# Altium schematic sheet MCU.SchDoc
size A; SheetNumber: 2; SheetTotal: 12
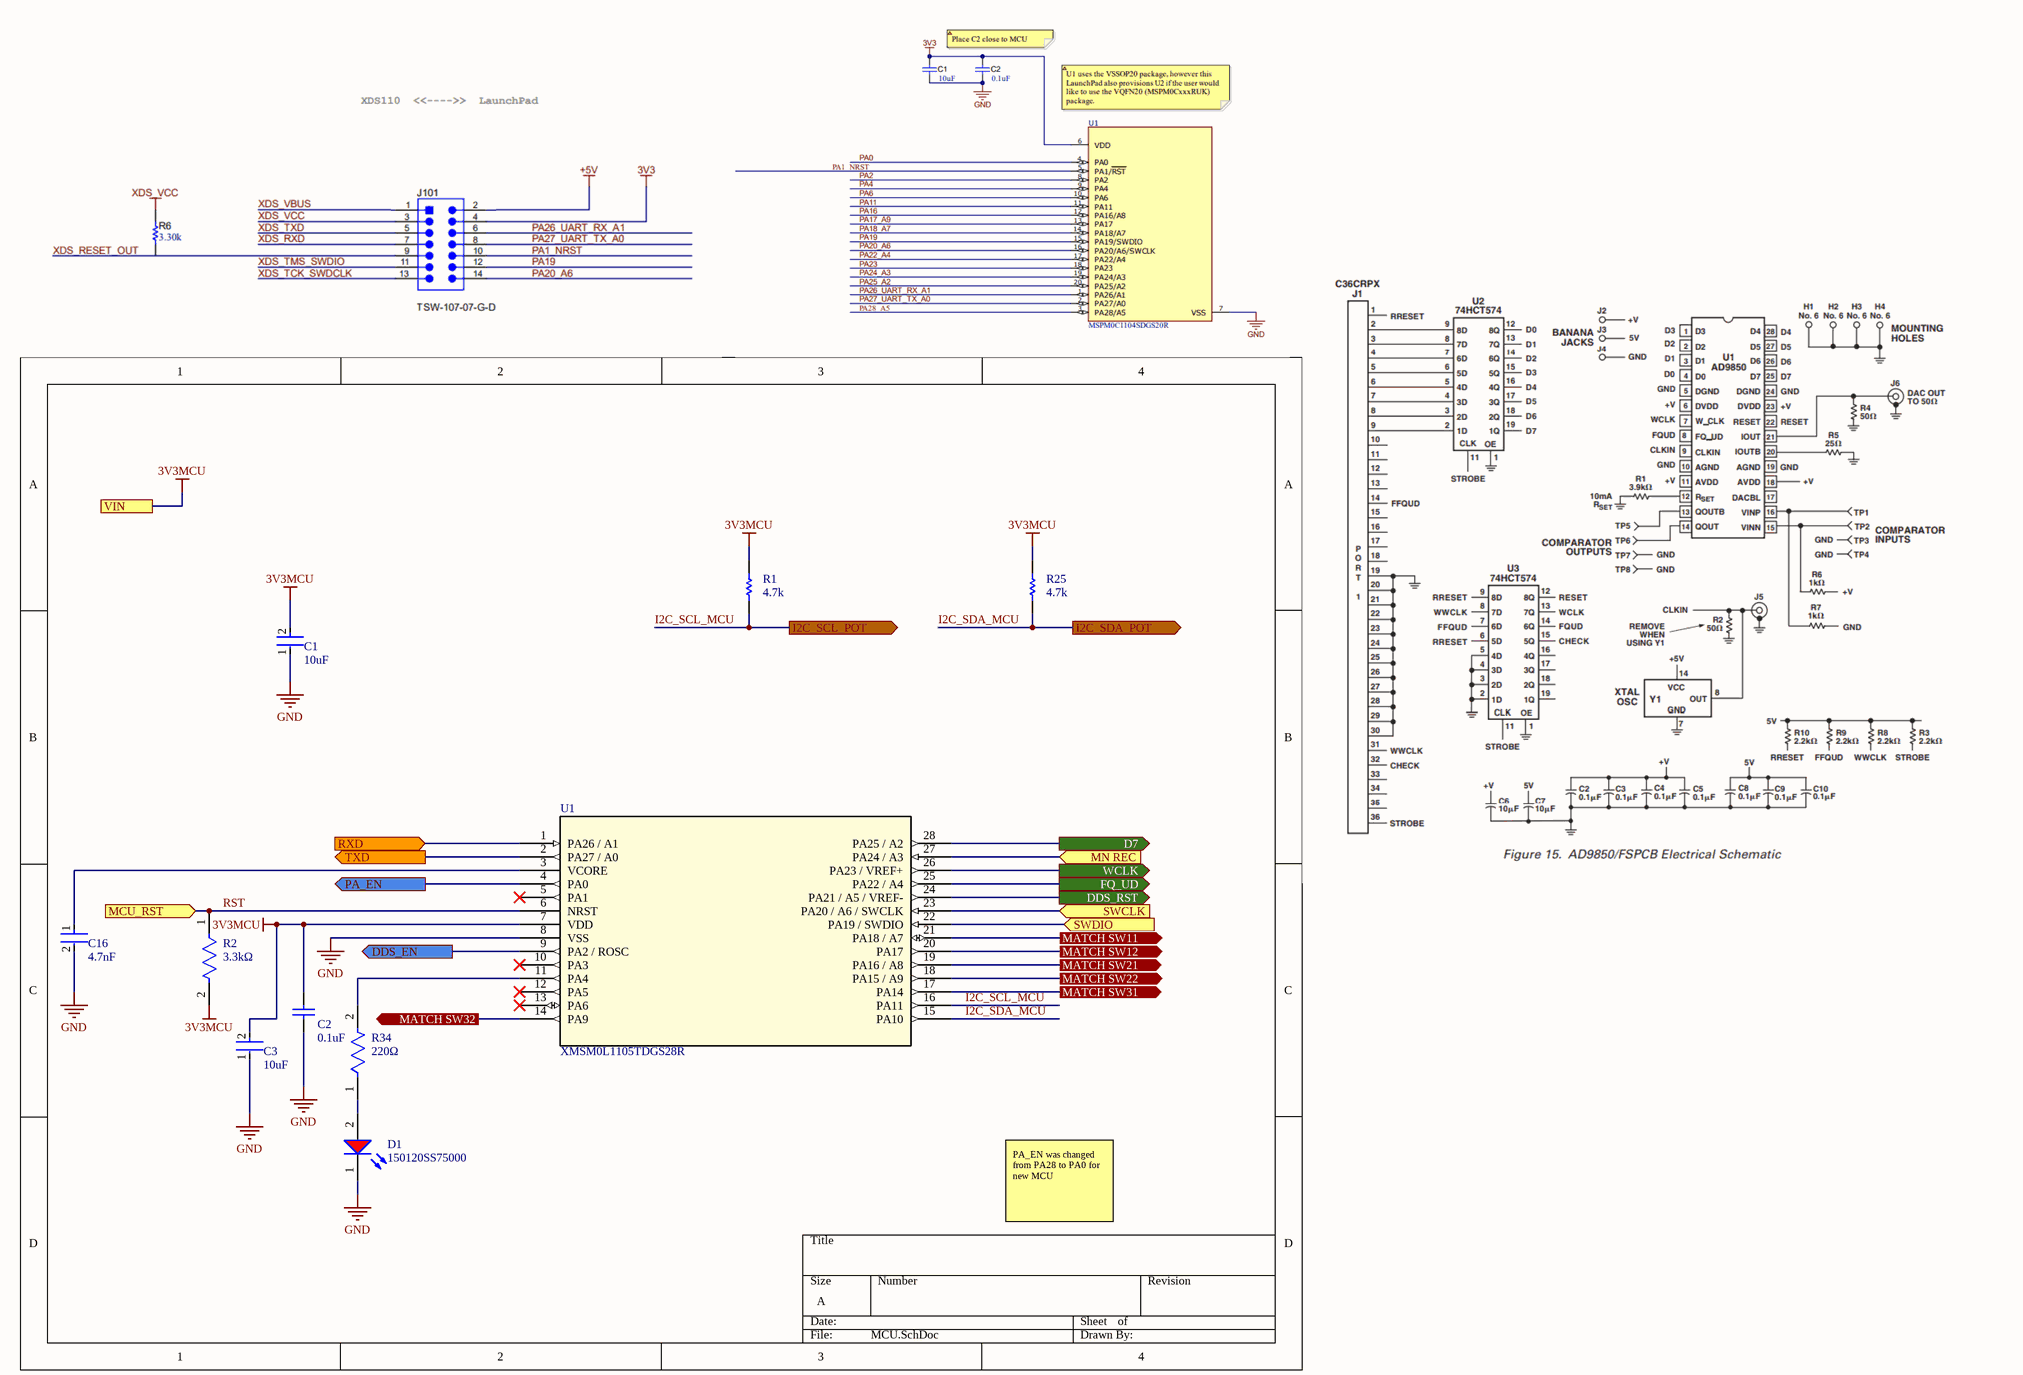
[diagram p0: MCU.SchDoc]

## Parts
C1  Capacitance: 10uF  [FP-C1608-080-0_1-MFG]  (hidden comment: C1608X5R1A106K080AC)
C2  value 0.1uF  [CAPC1608X92X38NL15T08]  (hidden comment: VJ0603Y104KXJAP)
C3  Capacitance: 10uF  [FP-C1608-080-0_1-MFG]  (hidden comment: C1608X5R1A106K080AC)
C16  Capacitance: 4.7nF  [FP-GRM188-0_1-e0_2_0_5-MFG]  (hidden comment: GRM1885C1H472JA01D)
D1  150120SS75000  [WL-SMCW_1206_150120xx75000]
R1  Resistance: 4.7k  [RESC1608X55X25LL10T15]  (hidden comment: RC0603FR-074K7L)
R2  Resistance: 3.3kΩ  [FP-ESR03-IPC_A]  (hidden comment: ESR03EZPF3301)
R25  Resistance: 4.7k  [RESC1608X55X25LL10T15]  (hidden comment: RC0603FR-074K7L)
R34  Resistance: 220Ω  [FP-CRCW0603-HPe3-IPC_A]  (hidden comment: CRCW0603220RFKEAHP)
U1  XMSM0L1105TDGS28R  [VSSOP28_DGS_TEX]

## Ports
D7 (out), DDS_EN (out), DDS_RST (out), FQ_UD (out), I2C_SCL_POT (out), I2C_SDA_POT (out), MATCH SW11 (out), MATCH SW12 (out), MATCH SW21 (out), MATCH SW22 (out), MATCH SW31 (out), MATCH SW32 (out), MCU_RST (in), MN REC (in), PA_EN (out), RXD (in), SWCLK (in), SWDIO (in), TXD (out), VIN, WCLK (out)

## Nets
3V3MCU: C1.2 C2.2 C3.2 R1.2 R2.2 R25.2 U1.7(VDD) ; port VIN
GND: C1.1 C2.1 C3.1 C16.2 D1.1(K) U1.8(VSS)
D7: U1.28(PA25_/_A2) ; port D7
DDS_EN: U1.9(PA2_/_ROSC) ; port DDS_EN
DDS_RST: U1.24(PA21_/_A5_/_VREF-) ; port DDS_RST
FQ_UD: U1.25(PA22_/_A4) ; port FQ_UD
I2C_SCL_MCU: R1.1 U1.16(PA11) ; port I2C_SCL_POT
I2C_SDA_MCU: R25.1 U1.15(PA10) ; port I2C_SDA_POT
MATCH SW11: U1.21(PA18_/_A7) ; port MATCH SW11
MATCH SW12: U1.20(PA17) ; port MATCH SW12
MATCH SW21: U1.19(PA16_/_A8) ; port MATCH SW21
MATCH SW22: U1.18(PA15_/_A9) ; port MATCH SW22
MATCH SW31: U1.17(PA14) ; port MATCH SW31
MATCH SW32: U1.14(PA9) ; port MATCH SW32
MN REC: U1.27(PA24_/_A3) ; port MN REC
PA_EN: U1.4(PA0) ; port PA_EN
RST: R2.1 U1.6(NRST) ; port MCU_RST
RXD: U1.1(PA26_/_A1) ; port RXD
SWCLK: U1.23(PA20_/_A6_/_SWCLK) ; port SWCLK
SWDIO: U1.22(PA19_/_SWDIO) ; port SWDIO
TXD: U1.2(PA27_/_A0) ; port TXD
WCLK: U1.26(PA23_/_VREF+) ; port WCLK
NetC16_1: C16.1 U1.3(VCORE)
NetD1_2: D1.2(A) R34.1
NetR34_2: R34.2 U1.11(PA4)

Not connected (* = marked no-connect by the designer): U1 5(PA1)* 10(PA3)* 12(PA5)* 13(PA6)*

## Notes on the sheet
- PA_EN was changed from PA28 to PA0 for new MCU

## Library data of the parts
C1 C3 = CMP-2000-04979-3: Multilayer Ceramic Capacitors 10μF ±10% 10V X5R SMD 0603; Dielectric Material: Ceramic; Construction: Flat; Height: 0.8mm; Thickness: 0.035inch; Case Code (Metric): 1608; Radiation Hardening: No; Number of Pins: 2; Voltage Rating (DC): 10V; Depth: 0.8mm; Voltage: 10V; RoHS Compliant: Yes; Voltage Rating: 10V; Package Quantity: 1; Resistor Type: Ceramic; Termination: SMD/SMT; Lead Free: Lead Free; REACH SVHC: No SVHC; Tolerance: 10%; Mount: Surface Mount; Series: C; Packaging: Tape and Reel; Width: 0.8mm; Dielectric: X5R; Weight: 7.1E-05oz; Length: 1.6mm; Max Operating Temperature: 85°C; Case Code (Imperial): 0603; Case/Package: 0603; Min Operating Temperature: -55°C
C2 = CMP-2006-01211-1: Manufacturer: Vitramon; Part Number: VJ0603Y104KXJAP
C16 = CMP-2006-02564-2: Chip Multilayer Ceramic Capacitors for General Purpose, 0603, 4700pF, C0G, 30ppm/°C, 5%, 50V; Case Code (Imperial): 0603; Width: 0.8mm; Package Quantity: 4000; Termination: SMD/SMT; Lead Free: Lead Free; Voltage Rating (DC): 50V; Dielectric: C0G; Height: 0.8mm; Tolerance: 5%; Thickness: 0.035inch; Min Operating Temperature: -55°C; Voltage Rating: 50V; Mount: Surface Mount; Max Operating Temperature: 125°C; Case Code (Metric): 1608; REACH SVHC: No SVHC; Material: Ceramic; Length: 1.6mm; Packaging: Tape and Reel; Case/Package: 0603
D1 = CMP-1426-00017-3: Led, Red, 630 Nm, 1.9 V, 30 Ma, 60 Mcd Rohs Compliant: Yes; Forward Current: 100mA; Max Reverse Voltage (DC): 5V; Lens Style: Clear, Rectangular; Viewing Angle: 140°; Luminous Intensity: 60mcd; Peak Wavelength: 645nm; Forward Voltage: 1.9V; Test Current: 20mA; Dominant Wavelength: 630nm; Case Code (Imperial): 1206; Length: 3.2mm; Mount: Surface Mount; Case Code (Metric): 3216; Case/Package: 1206; Min Operating Temperature: -40°C; Width: 1.6mm; Color: Red; Height: 680µm; REACH SVHC: Unknown; Max Operating Temperature: 85°C; Wavelength: 630nm; RoHS: Compliant; Packaging: Tape and Reel
R1 R25 = CMP-2000-06942-1: Chip Resistor, 4.7 KOhm, +/- 1%, 0.1 W, -55 to 155 degC, 0603 (1608 Metric), RoHS, Tape and Reel; Manufacturer: Yageo; Power Rating: 100mW; Temperature Coefficient: 100PPM/C; Voltage Rating: 50V; Package Reference: 0603; Series: RC; Datasheet Version: Rev. 7, 05/2017; Packaging: Reel; Termination Style: SMD/SMT; Datasheet URL: http://www.yageo.com/documents/recent/PYu-RC_Group_51_RoHS_L_7.pdf; Manufacturer URL: http://www.yageo.com/; Package Description: 2-Pin Surface Mount Device, Body 1.6 x 0.8 mm; Case Code - mm: 1608; Case Code - in: 0603; Mounting Technology: SurfaceMount; Operating Temperature Range: -55Cto+155C; Tolerance: 1%; Product: ThickFilmResistorsGeneralPurpose
R2 = CMP-08839-028747-1: 3.3kΩ ±1% 0.25W 0603 Anti-Surge Chip Resistor AEC-Q200; Temperature Coefficient: 100ppm/°C; Max Power Dissipation: 250mW; Tolerance: 1%; Min Operating Temperature: -55°C; Features: Automotive AEC-Q200; Max Operating Temperature: 155°C; Number of Terminations: 2; Series: ESR; Packaging: Tape and Reel; Resistor Type: Thick Film; RoHS Compliant: Yes; Case/Package: 0603
R34 = CMP-02407-003593-1: RES Thick Film, 220Ω, 1%, 0.33W, 100ppm/°C, 0603; Max Power Dissipation: 250mW; Voltage Rating (DC): 75V; Radiation Hardening: No; Contact Plating: Tin; Length: 1.6mm; Depth: 0.85mm; Composition: Thick Film; Lead Free: Lead Free; Mount: Surface Mount; Package Quantity: 5000; Height: 0.45mm; Termination: SMD/SMT; Weight: 7.1E-05oz; Military Standard: Not; Number of Terminations: 2; Case Code (Metric): 1608; Max Operating Temperature: 155°C; Power Rating: 250mW; Tolerance: 1%; Temperature Coefficient: 100ppm/°C; Features: Automotive AEC-Q200; Case Code (Imperial): 0603; Width: 0.033inch; Min Operating Temperature: -55°C; Case/Package: 0603; Voltage Rating: 75V; Packaging: Tape and Reel
U1 = XMSM0L1105TDGS28R: 32-MHz ArmÂ® CortexÂ®-M0+ MCU with 32-KB flash, 4-KB SRAM, 12-bit ADC 28-VSSOP -40 to 105; Manufacturer_Name: Texas Instruments; Type: Embedded; Copyright: Copyright (C) 2026 Ultra Librarian. All rights reserved.; Manufacturer_Part_Number: XMSM0L1105TDGS28R; RefDes: RefDes